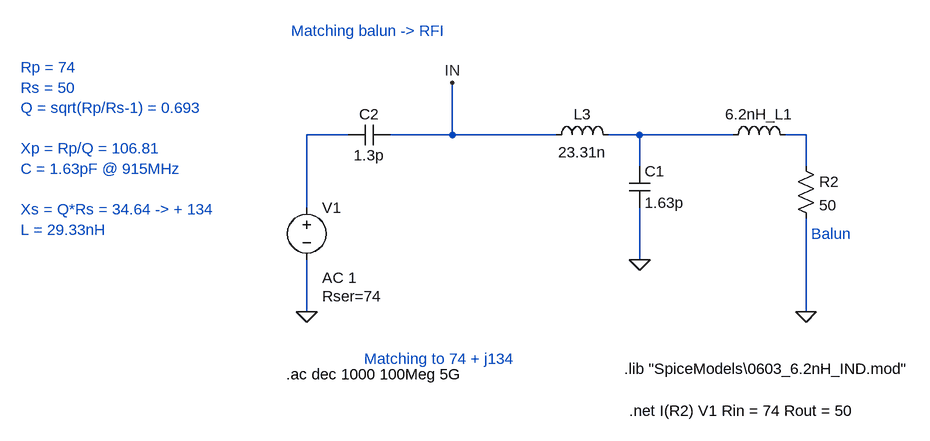
[diagram p0: schematic Balun_To_RFI_Idea.asc]
Balun_To_RFI_Idea.asc, the LTspice schematic file:
Version 4.1
SHEET 1 924 680
WIRE 16 32 -48 32
WIRE 176 32 176 -48
WIRE 176 32 80 32
WIRE 336 32 176 32
WIRE 464 32 416 32
WIRE 608 32 464 32
WIRE 720 32 688 32
WIRE 464 80 464 32
WIRE 720 80 720 32
WIRE -48 144 -48 32
WIRE 464 224 464 144
WIRE -48 304 -48 224
WIRE 720 304 720 160
FLAG -48 304 0
FLAG 720 304 0
FLAG 176 -48 IN
FLAG 464 224 0
SYMBOL voltage -48 128 R0
WINDOW 123 24 124 Left 2
WINDOW 39 24 152 Left 2
SYMATTR Value2 AC 1
SYMATTR SpiceLine Rser=74
SYMATTR InstName V1
SYMATTR Value ""
SYMBOL res 704 64 R0
SYMATTR InstName R2
SYMATTR Value 50
SYMBOL cap 448 80 R0
SYMATTR InstName C1
SYMATTR Value 1.63p
SYMBOL ind 592 48 R270
WINDOW 0 32 56 VTop 2
WINDOW 3 5 56 Invisible 2
SYMATTR InstName 6.2nH_L1
SYMATTR Value LQG18HH6N2S00
SYMATTR Prefix X
SYMATTR SpiceLine Rser=0
SYMBOL ind 320 48 R270
WINDOW 0 32 56 VTop 2
WINDOW 3 5 56 VBottom 2
SYMATTR InstName L3
SYMATTR Value 23.31n
SYMATTR SpiceLine Rser=1m
SYMBOL cap 80 16 R90
WINDOW 0 0 32 VBottom 2
WINDOW 3 32 32 VTop 2
SYMATTR InstName C2
SYMATTR Value 1.3p
TEXT 40 376 Left 2 ;Matching to 74 + j134
TEXT -72 -128 Left 2 ;Matching balun -> RFI
TEXT -488 -72 Left 2 ;Rp = 74\nRs = 50\nQ = sqrt(Rp/Rs-1) = 0.693\n \nXp = Rp/Q = 106.81\nC = 1.63pF @ 915MHz\n \nXs = Q*Rs = 34.64 -> + 134\nL = 29.33nH
TEXT -80 400 Left 2 !.ac dec 1000 100Meg 5G
TEXT 440 392 Left 2 !.lib "SpiceModels\\0603_6.2nH_IND.mod"
TEXT 448 456 Left 2 !.net I(R2) V1 Rin = 74 Rout = 50
TEXT 728 184 Left 2 ;Balun

The netlist it stands for:
* Balun_To_RFI_Idea.asc
V1 N001 0 AC 1 Rser=74
R2 N003 0 50
C1 N002 0 1.63p
X§6.2nH_L1 N002 N003 LQG18HH6N2S00 Rser=0  ; pins A B
L3 IN N002 23.31n Rser=1m
C2 IN N001 1.3p
* Matching to 74 + j134
* Matching balun -> RFI
* Rp = 74
* Rs = 50
* Q = sqrt(Rp/Rs-1) = 0.693
* Xp = Rp/Q = 106.81
* C = 1.63pF @ 915MHz
* Xs = Q*Rs = 34.64 -> + 134
* L = 29.33nH
.ac dec 1000 100Meg 5G
.lib "SpiceModels\0603_6.2nH_IND.mod"
.net I(R2) V1 Rin = 74 Rout = 50
* Balun
.backanno
.end